# Altium schematic sheet Connectors.SchDoc
size 406 x 304 mm; SheetNumber: 8; SheetTotal: 8
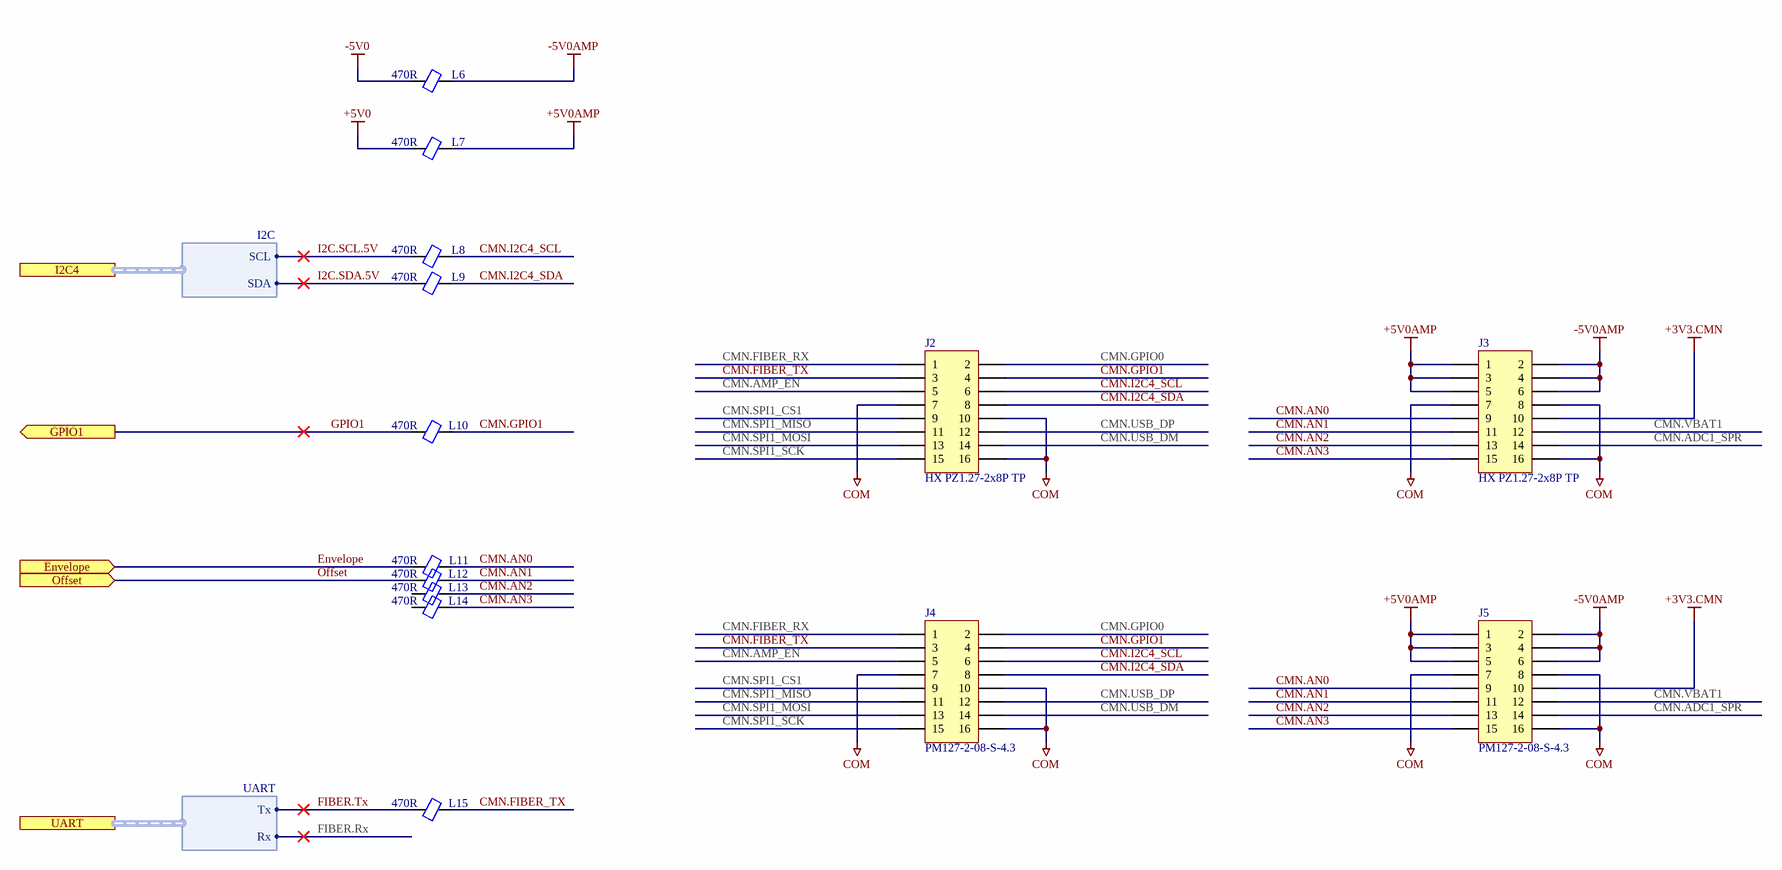
[diagram p0: Connectors.SchDoc]

## Parts
J2  HX PZ1.27-2x8P TP  [HANXIA_HX PZ1.27-2x8P TP]
J3  HX PZ1.27-2x8P TP  [HANXIA_HX PZ1.27-2x8P TP]
J4  PM127-2-08-S-4.3  [HCTL_PM127-2-08-S-4.3]
J5  PM127-2-08-S-4.3  [HCTL_PM127-2-08-S-4.3]
L6  470R  [INDC1005X05N]
L7  470R  [INDC1005X05N]
L8  470R  [INDC1005X05N]
L9  470R  [INDC1005X05N]
L10  470R  [INDC1005X05N]
L11  470R  [INDC1005X05N]
L12  470R  [INDC1005X05N]
L13  470R  [INDC1005X05N]
L14  470R  [INDC1005X05N]
L15  470R  [INDC1005X05N]

## Ports
Envelope (in), GPIO1 (out), I2C4 (harness I2C), Offset (in), UART (harness UART)

## Harnesses
I2C: SCL, SDA
UART: Tx, Rx

## Nets
+3V3.CMN: J3.10 J5.10
+5V0: L7.1
+5V0AMP: J3.1 J3.3 J3.5 J5.1 J5.3 J5.5 L7.2
-5V0: L6.1
-5V0AMP: J3.2 J3.4 J3.6 J5.2 J5.4 J5.6 L6.2
COM: J2.7 J2.10 J2.16 J3.7 J3.8 J3.16 J4.7 J4.10 J4.16 J5.7 J5.8 J5.16
CMN.ADC1_SPR: J3.14 J5.14
CMN.AMP_EN: J2.5 J4.5
CMN.AN0: J3.9 J5.9 L11.2
CMN.AN1: J3.11 J5.11 L12.2
CMN.AN2: J3.13 J5.13 L13.2
CMN.AN3: J3.15 J5.15 L14.2
CMN.FIBER_RX: J2.1 J4.1
CMN.FIBER_TX: J2.3 J4.3 L15.2
CMN.GPIO0: J2.2 J4.2
CMN.GPIO1: J2.4 J4.4 L10.2
CMN.I2C4_SCL: J2.6 J4.6 L8.2
CMN.I2C4_SDA: J2.8 J4.8 L9.2
CMN.SPI1_CS1: J2.9 J4.9
CMN.SPI1_MISO: J2.11 J4.11
CMN.SPI1_MOSI: J2.13 J4.13
CMN.SPI1_SCK: J2.15 J4.15
CMN.USB_DM: J2.14 J4.14
CMN.USB_DP: J2.12 J4.12
CMN.VBAT1: J3.12 J5.12
Envelope: L11.1 ; port Envelope
FIBER.Rx: port UART.Rx
FIBER.Tx: L15.1 ; port UART.Tx
GPIO1: L10.1 ; port GPIO1
I2C.SCL.5V: L8.1 ; port I2C4.SCL
I2C.SDA.5V: L9.1 ; port I2C4.SDA
Offset: L12.1 ; port Offset

Not connected (* = marked no-connect by the designer): L13 1; L14 1

## Notes on the sheet
- Sheet Name:
- Date:
- Sheet
- Designer:
- of

## Library data of the parts
J2 J3 = CONN,Hdr,2x8 Pin,1.27mm,SMD: CONN HEADER 16POS 1.27mm DUAL ROW SMD; Manufacturer 1: hanxia; Vendor 1 Part Number: C41376040; Vendor 1: LCSC; Part Name: CONN,Hdr,2x8 Pin,1.27mm,SMD; CreatedBy: Judd Foster; HelpURL: https://www.lcsc.com/datasheet/C41376040.pdf?spm=wm.sxq.inf.ggs___wm.fly.bg.0.xh&lcsc_vid=T1ELXwUHQlNYVlZRE1JdXlRQFVgNBF1eTlFXBVxWRAAxVlNeQ1lYVlFUQlNXXjsOAxUeFF5JWBYZEEoKFBINSQcJGk4eFQsCAgIaSgADAwAHC0slRFhZUlVVQ08GEwkK; Manufacturer 1 Part Number: HX PZ1.27-2x8P TP
J4 J5 = CONN,Rcpt,2x8 Pin,1.27mm,SMD: CONN SOCKET 16POS 1.27mm DUAL ROW SMD; Manufacturer 1: HCTL; Vendor 1 Part Number: C3975134; Vendor 1: LCSC; Part Name: CONN,Rcpt,2x8 Pin,1.27mm,SMD; CreatedBy: Judd Foster; HelpURL: https://www.lcsc.com/datasheet/C3975134.pdf?spm=wm.sxq.inf.ggs___wm.fly.bg.0.xh&lcsc_vid=T1ELXwUHQlNYVlZRE1JdXlRQFVgNBF1eTlFXBVxWRAAxVlNeQ1lYVldfR1VbXjsOAxUeFF5JWBYZEEoKFBINSQcJGk4dAgUUFAk%3D; Manufacturer 1 Part Number: PM127-2-08-S-4.3
L6-L15 = Ferrite,470R@100MHz,0402: 470 Ohms @ 100 MHz 1 Power Line Ferrite Bead 0402 (1005 Metric) 1A 200mOhm; Manufacturer 1: Murata Electronics; Manufacturer 1 Part Number: BLM15PX471SN1D; Vendor 1 Part Number: 490-10662-1-ND; Vendor 1: Digikey; Part Name: Ferrite,470R@100MHz,0402; CreatedBy: Judd Foster; HelpURL: https://www.murata.com/en-us/products/productdata/8796740059166/ENFA0018.pdf; Value: 470R